# Altium schematic sheet Connectors.SchDoc
size A; SheetNumber: 5; SheetTotal: 5
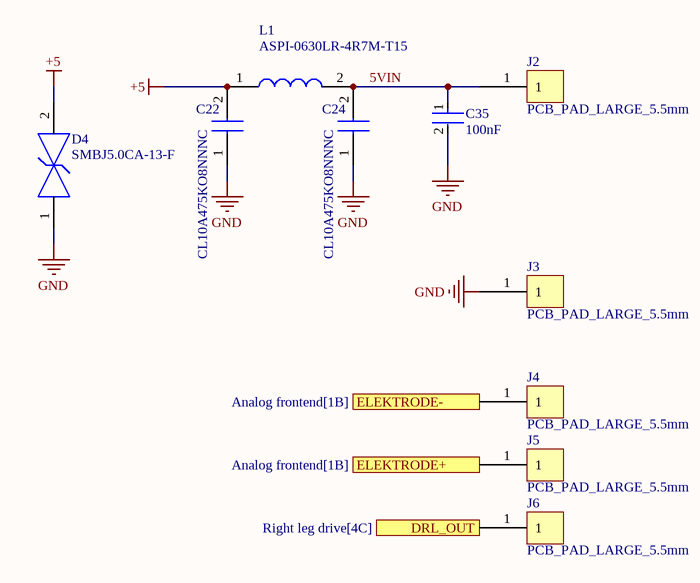
[diagram p0: Connectors.SchDoc]

## Parts
C22  CL10A475KO8NNNC  [CAPC1608X90N]
C24  CL10A475KO8NNNC  [CAPC1608X90N]
C35  value 100nF  [FP-CC0603-DA-IPC_B]  (hidden comment: CC0603KRX7R9BB104)
D4  SMBJ5.0CA-13-F  [FP-SMB-CA-MFG]
J2  PCB_PAD_LARGE_5.5mm  [PCB_MOTOR_PAD-Footprint-1]
J3  PCB_PAD_LARGE_5.5mm  [PCB_MOTOR_PAD-Footprint-1]
J4  PCB_PAD_LARGE_5.5mm  [PCB_MOTOR_PAD-Footprint-1]
J5  PCB_PAD_LARGE_5.5mm  [PCB_MOTOR_PAD-Footprint-1]
J6  PCB_PAD_LARGE_5.5mm  [PCB_MOTOR_PAD-Footprint-1]
L1  ASPI-0630LR-4R7M-T15  [ASPI-0630LR]

## Ports
DRL_OUT (see Right leg drive[4C]), ELEKTRODE+ (see Analog frontend[1B]), ELEKTRODE- (see Analog frontend[1B])

## Nets
+5: C22.2 D4.2 L1.1
GND: C22.1 C24.1 C35.2 D4.1 J3.1
5VIN: C24.2 C35.1 J2.1 L1.2
DRL_OUT: J6.1 ; port DRL_OUT
ELEKTRODE+: J5.1 ; port ELEKTRODE+
ELEKTRODE-: J4.1 ; port ELEKTRODE-

## Library data of the parts
C22 C24 = CL10A475KO8NNNC: Capacitor; Manufacturer_Name: SAMSUNG; Datasheet Link: https://rs.componentsearchengine.com/Datasheets/2/CL10A475KO8NNNC.pdf; Height: 0.9mm; Manufacturer_Part_Number: CL10A475KO8NNNC; Mouser Part Number: 187-CL10A475KO8NNNC; Mouser Price/Stock: https://www.mouser.co.uk/ProductDetail/Samsung-Electro-Mechanics/CL10A475KO8NNNC?qs=X6jEic%2FHinAbIjmLnFfqqQ%3D%3D; Arrow Part Number: CL10A475KO8NNNC; Arrow Price/Stock: https://www.arrow.com/en/products/cl10a475ko8nnnc/samsung-electro-mechanics.html?utm_currency=USD&region=nac
C35 = CMP-001-00148-1: Multilayer Ceramic Capacitor, CC Series, 0.1 - F, - 10%, X7R, 50 V, 0603 [1608 Metric]; Voltage Rating: 50V; Mounting Technology: Surface Mount; Tolerance: 10%; Case/Package: 0603; Max Operating Temperature: 125°C; Min Operating Temperature: -55°C; Pins: 2; Lead Free: Lead Free; Case Code (Metric): 1608; Width: 800µm; Termination: SMD/SMT; Depth: 800µm; RoHS: Compliant; Material: Ceramic; Dielectric: X7R; Schedule B: 8532240020, 8532240020; Country of Origin: Mainland China, Taiwan; Lifecycle Status: Production; Radiation Hardening: No; Case Code (Imperial): 0603; Height: 800µm; Number of Terminals: 2; China RoHS: Compliant; Voltage Rating (DC): 50V; Export Control Classification Number (ECCN) Code: EAR99; Halogen Free: Halogen Free; Thickness: 889µm; Voltage: 50V; Length: 1.6mm; Harmonized Tariff Schedule (HTS) Code: 8532.24.00.20; REACH SVHC: Unaffected; Introduction Date: 2005-08-18; Dielectric Material: Ceramic
D4 = CMP-004-00056-1: SMBJ5.0CA Series 600 W 5.0 V Surface Mount Bi-Directional TVS Diode - DO-214AA; Max Breakdown Voltage: 7.23V; Test Current: 10mA; Number of Channels: 1; Reverse Breakdown Voltage: 6.4V; Power Dissipation: 600W; Voltage Rating (DC): 5V; Breakdown Voltage: 6.8V; Max Output current: 65.2A; Clamping Voltage: 9.2V; Polarity: Bidirectional; Max Junction Temperature (Tj): 150°C; Max Reverse Leakage Current: 1.6mA; Value: 1nF; Max Power Dissipation: 5W; Element Configuration: Single; Schedule B: 8541100050, 8541100050; Packaging: Cut Tape; Mounting Technology: Surface Mount; Min Breakdown Voltage: 6.4V; Number of Elements: 1; Width: 3.9mm; Max Surge Current: 65.2A; Height: 2.5mm; Radiation Hardening: No; Length: 4.57mm; Pins: 2; RoHS: Compliant; Peak Pulse Power: 600W; Min Operating Temperature: -55°C; Case/Package: SMB; Number of Terminals: 2; Max Operating Temperature: 150°C; China RoHS: Non-Compliant; Leakage Current: 1.6mA; Reverse Standoff Voltage: 5V; Peak Pulse Current: 65.2A; REACH SVHC: Affected; Lead Free: Contains Lead; Termination: SMD/SMT; Lifecycle Status: Production; Direction: Bidirectional; Power Rating: 600W; Working Voltage: 5V
J2-J6 = CMP-002-00094-2: Large PCB pad
L1 = ASPI-0630LR-4R7M-T15: Inductor; Manufacturer_Name: ABRACON; Datasheet Link: https://abracon.com/Magnetics/power/ASPI-0630LR.pdf; Manufacturer_Part_Number: ASPI-0630LR-4R7M-T15; Mouser Part Number: 815-ASPI0630LR4R7T15; Mouser Price/Stock: https://www.mouser.co.uk/ProductDetail/ABRACON/ASPI-0630LR-4R7M-T15?qs=bWAYEm3xoCYVuRmkzS1c6A%3D%3D; Arrow Part Number: ASPI-0630LR-4R7M-T15; Arrow Price/Stock: https://www.arrow.com/en/products/aspi-0630lr-4r7m-t15/abracon?utm_currency=USD&region=nac